# Altium schematic sheet drawing_sheet.SchDoc: Test board
size 254 x 203 mm; DrawnBy: J. Smith; DocumentNumber: CD001
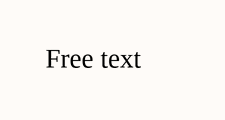
[diagram p0: drawing_sheet.SchDoc]

## Notes on the sheet
- Free text
- Drawn by: